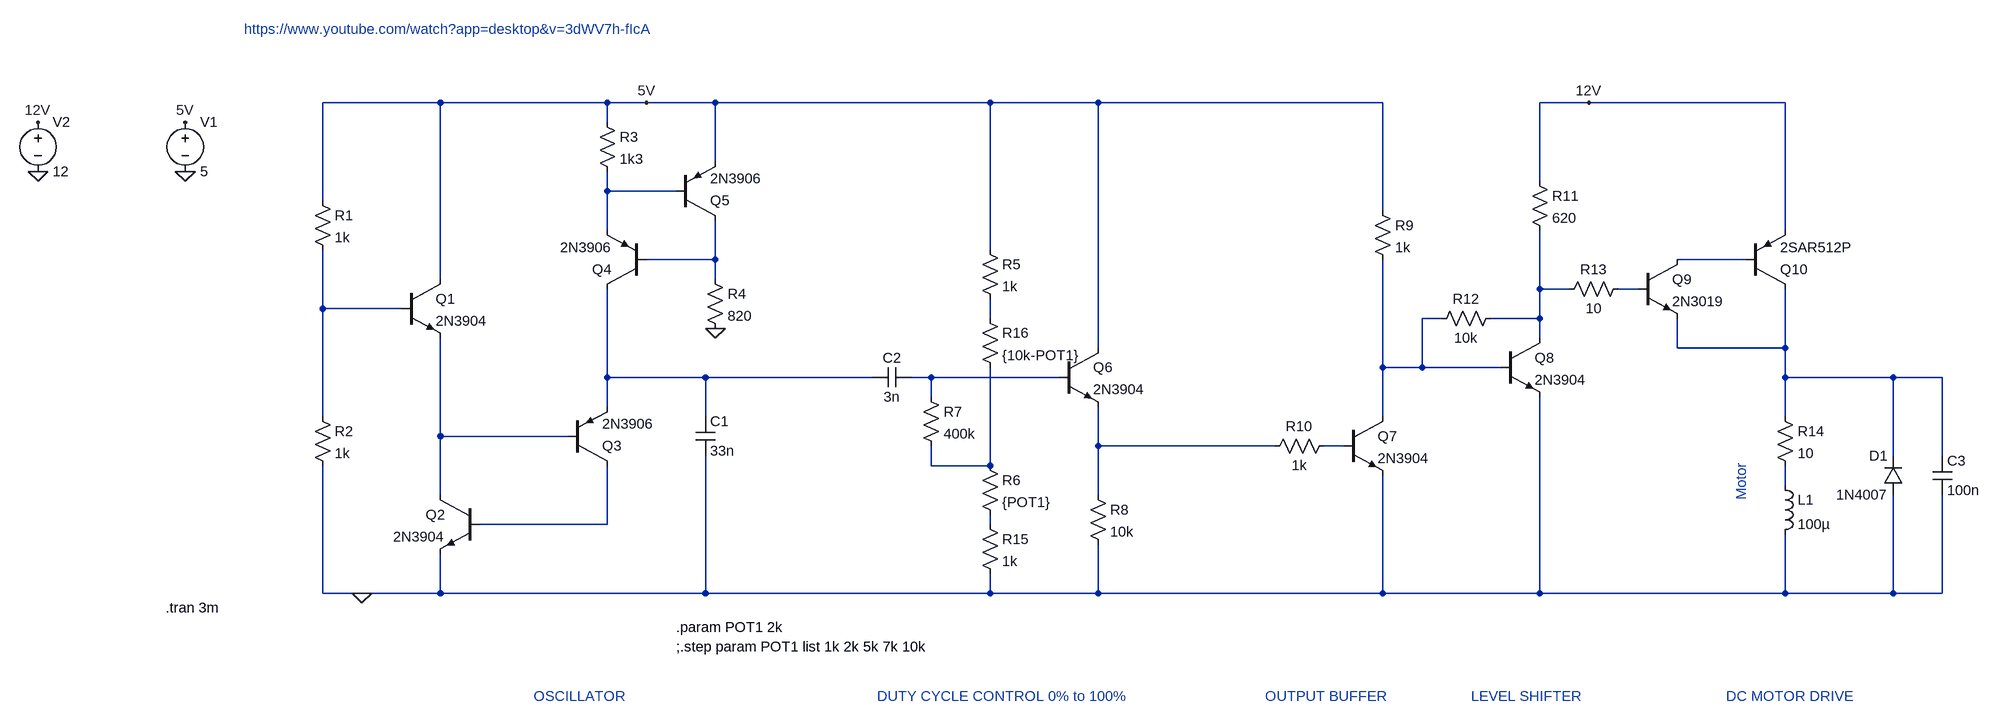
[diagram p0: schematic sawtooth_oscillator.asc]
sawtooth_oscillator.asc, the LTspice schematic file:
Version 4.1
SHEET 1 2824 824
WIRE 304 -160 112 -160
WIRE 576 -160 304 -160
WIRE 640 -160 576 -160
WIRE 752 -160 640 -160
WIRE 1200 -160 752 -160
WIRE 1376 -160 1200 -160
WIRE 1840 -160 1376 -160
WIRE 2176 -160 2096 -160
WIRE 2496 -160 2176 -160
WIRE 576 -128 576 -160
WIRE 752 -64 752 -160
WIRE 2096 -32 2096 -160
WIRE 576 -16 576 -48
WIRE 688 -16 576 -16
WIRE 112 0 112 -160
WIRE 1840 16 1840 -160
WIRE 576 48 576 -16
WIRE 2496 48 2496 -160
WIRE 1200 80 1200 -160
WIRE 752 96 752 32
WIRE 752 96 640 96
WIRE 2432 96 2320 96
WIRE 304 128 304 -160
WIRE 752 128 752 96
WIRE 2096 144 2096 48
WIRE 2144 144 2096 144
WIRE 2256 144 2224 144
WIRE 112 176 112 80
WIRE 240 176 112 176
WIRE 1200 192 1200 160
WIRE 1936 192 1904 192
WIRE 2096 192 2096 144
WIRE 2096 192 2016 192
WIRE 2096 224 2096 192
WIRE 1376 240 1376 -160
WIRE 2320 240 2320 192
WIRE 2496 240 2496 144
WIRE 2496 240 2320 240
WIRE 1840 272 1840 96
WIRE 1904 272 1904 192
WIRE 1904 272 1840 272
WIRE 2032 272 1904 272
WIRE 576 288 576 144
WIRE 736 288 576 288
WIRE 1008 288 736 288
WIRE 1104 288 1072 288
WIRE 1312 288 1104 288
WIRE 2496 288 2496 240
WIRE 2672 288 2496 288
WIRE 2752 288 2672 288
WIRE 1104 320 1104 288
WIRE 576 336 576 288
WIRE 112 352 112 176
WIRE 736 352 736 288
WIRE 1840 352 1840 272
WIRE 2496 352 2496 288
WIRE 304 384 304 224
WIRE 512 384 304 384
WIRE 1376 400 1376 336
WIRE 1664 400 1376 400
WIRE 1776 400 1744 400
WIRE 2672 416 2672 288
WIRE 2752 416 2752 288
WIRE 1104 432 1104 400
WIRE 1200 432 1200 272
WIRE 1200 432 1104 432
WIRE 2496 464 2496 432
WIRE 304 480 304 384
WIRE 1376 480 1376 400
WIRE 576 528 576 432
WIRE 576 528 368 528
WIRE 1200 528 1200 512
WIRE 112 640 112 432
WIRE 176 640 112 640
WIRE 304 640 304 576
WIRE 304 640 176 640
WIRE 736 640 736 416
WIRE 736 640 304 640
WIRE 1200 640 1200 608
WIRE 1200 640 736 640
WIRE 1376 640 1376 560
WIRE 1376 640 1200 640
WIRE 1840 640 1840 448
WIRE 1840 640 1376 640
WIRE 2096 640 2096 320
WIRE 2096 640 1840 640
WIRE 2496 640 2496 544
WIRE 2496 640 2096 640
WIRE 2672 640 2672 480
WIRE 2672 640 2496 640
WIRE 2752 640 2752 480
WIRE 2752 640 2672 640
FLAG 752 208 0
FLAG -112 -48 0
FLAG -112 -128 5V
FLAG 640 -160 5V
FLAG 176 640 0
FLAG -352 -48 0
FLAG -352 -128 12V
FLAG 2176 -160 12V
SYMBOL npn 240 128 R0
SYMATTR InstName Q1
SYMATTR Value 2N3904
SYMBOL npn 368 480 M0
SYMATTR InstName Q2
SYMATTR Value 2N3904
SYMBOL pnp 512 432 M180
SYMATTR InstName Q3
SYMATTR Value 2N3906
SYMBOL res 96 -16 R0
SYMATTR InstName R1
SYMATTR Value 1k
SYMBOL res 96 336 R0
SYMATTR InstName R2
SYMATTR Value 1k
SYMBOL res 560 -144 R0
SYMATTR InstName R3
SYMATTR Value 1k3
SYMBOL res 736 112 R0
SYMATTR InstName R4
SYMATTR Value 820
SYMBOL cap 720 352 R0
SYMATTR InstName C1
SYMATTR Value 33n
SYMBOL pnp 640 144 R180
SYMATTR InstName Q4
SYMATTR Value 2N3906
SYMBOL pnp 688 32 M180
SYMATTR InstName Q5
SYMATTR Value 2N3906
SYMBOL voltage -112 -144 R0
WINDOW 123 0 0 Left 0
WINDOW 39 0 0 Left 0
SYMATTR InstName V1
SYMATTR Value 5
SYMBOL npn 1312 240 R0
SYMATTR InstName Q6
SYMATTR Value 2N3904
SYMBOL cap 1072 272 R90
WINDOW 0 0 32 VBottom 2
WINDOW 3 32 32 VTop 2
SYMATTR InstName C2
SYMATTR Value 3n
SYMBOL res 1184 64 R0
SYMATTR InstName R5
SYMATTR Value 1k
SYMBOL res 1184 416 R0
SYMATTR InstName R6
SYMATTR Value {POT1}
SYMBOL res 1088 304 R0
SYMATTR InstName R7
SYMATTR Value 400k
SYMBOL res 1360 464 R0
SYMATTR InstName R8
SYMATTR Value 10k
SYMBOL res 1824 0 R0
SYMATTR InstName R9
SYMATTR Value 1k
SYMBOL res 1760 384 R90
WINDOW 0 0 56 VBottom 2
WINDOW 3 32 56 VTop 2
SYMATTR InstName R10
SYMATTR Value 1k
SYMBOL npn 1776 352 R0
SYMATTR InstName Q7
SYMATTR Value 2N3904
SYMBOL npn 2032 224 R0
SYMATTR InstName Q8
SYMATTR Value 2N3904
SYMBOL npn 2256 96 R0
SYMATTR InstName Q9
SYMATTR Value 2N3019
SYMBOL res 2080 -48 R0
SYMATTR InstName R11
SYMATTR Value 620
SYMBOL res 2032 176 R90
WINDOW 0 0 56 VBottom 2
WINDOW 3 32 56 VTop 2
SYMATTR InstName R12
SYMATTR Value 10k
SYMBOL voltage -352 -144 R0
WINDOW 123 0 0 Left 0
WINDOW 39 0 0 Left 0
SYMATTR InstName V2
SYMATTR Value 12
SYMBOL res 2240 128 R90
WINDOW 0 0 56 VBottom 2
WINDOW 3 32 56 VTop 2
SYMATTR InstName R13
SYMATTR Value 10
SYMBOL pnp 2432 144 M180
SYMATTR InstName Q10
SYMATTR Value 2SAR512P
SYMBOL res 2480 336 R0
SYMATTR InstName R14
SYMATTR Value 10
SYMBOL ind 2480 448 R0
SYMATTR InstName L1
SYMATTR Value 100µ
SYMATTR SpiceLine Rser=1m
SYMBOL diode 2688 480 R180
WINDOW 0 24 64 Left 2
WINDOW 3 24 0 Left 2
SYMATTR InstName D1
SYMATTR Value 1N4007
SYMBOL cap 2736 416 R0
SYMATTR InstName C3
SYMATTR Value 100n
SYMBOL res 1184 512 R0
SYMATTR InstName R15
SYMATTR Value 1k
SYMBOL res 1184 176 R0
SYMATTR InstName R16
SYMATTR Value {10k-POT1}
TEXT -16 -280 Left 2 ;https://www.youtube.com/watch?app=desktop&v=3dWV7h-fIcA
TEXT -144 664 Left 2 !.tran 3m
TEXT 456 808 Left 2 ;OSCILLATOR
TEXT 1016 808 Left 2 ;DUTY CYCLE CONTROL 0% to 100%
TEXT 1648 808 Left 2 ;OUTPUT BUFFER
TEXT 1984 808 Left 2 ;LEVEL SHIFTER
TEXT 2400 808 Left 2 ;DC MOTOR DRIVE
TEXT 2424 488 VLeft 2 ;Motor
TEXT 688 696 Left 2 !.param POT1 2k\n;.step param POT1 list 1k 2k 5k 7k 10k

The netlist it stands for:
* sawtooth_oscillator.asc
Q1 5V N006 N012 0 2N3904
Q2 N012 N017 0 0 2N3904
Q3 N017 N012 N010 0 2N3906
R1 5V N006 1k
R2 N006 0 1k
R3 5V N001 1k3
R4 N002 0 820
C1 N010 0 33n
Q4 N010 N002 N001 0 2N3906
Q5 N002 N001 5V 0 2N3906
V1 5V 0 5
Q6 5V N011 N013 0 2N3904
C2 N011 N010 3n
R5 5V N007 1k
R6 N015 N018 {POT1}
R7 N011 N015 400k
R8 N013 0 10k
R9 5V N008 1k
R10 N014 N013 1k
Q7 N008 N014 0 0 2N3904
Q8 N004 N008 0 0 2N3904
Q9 N003 N005 N009 0 2N3019
R11 12V N004 620
R12 N004 N008 10k
V2 12V 0 12
R13 N005 N004 10
Q10 N009 N003 12V 0 2SAR512P
R14 N009 N016 10
L1 N016 0 100µ Rser=1m
D1 0 N009 1N4007
C3 N009 0 100n
R15 N018 0 1k
R16 N007 N015 {10k-POT1}
.model D D
.lib standard.dio
.model NPN NPN
.model PNP PNP
.lib standard.bjt
* https://www.youtube.com/watch?app=desktop&v=3dWV7h-fIcA
.tran 3m
* OSCILLATOR
* DUTY CYCLE CONTROL 0% to 100%
* OUTPUT BUFFER
* LEVEL SHIFTER
* DC MOTOR DRIVE
* Motor
.param POT1 2k
;.step param POT1 list 1k 2k 5k 7k 10k
.backanno
.end